# Altium project 底板开发板_Project.PrjPcb
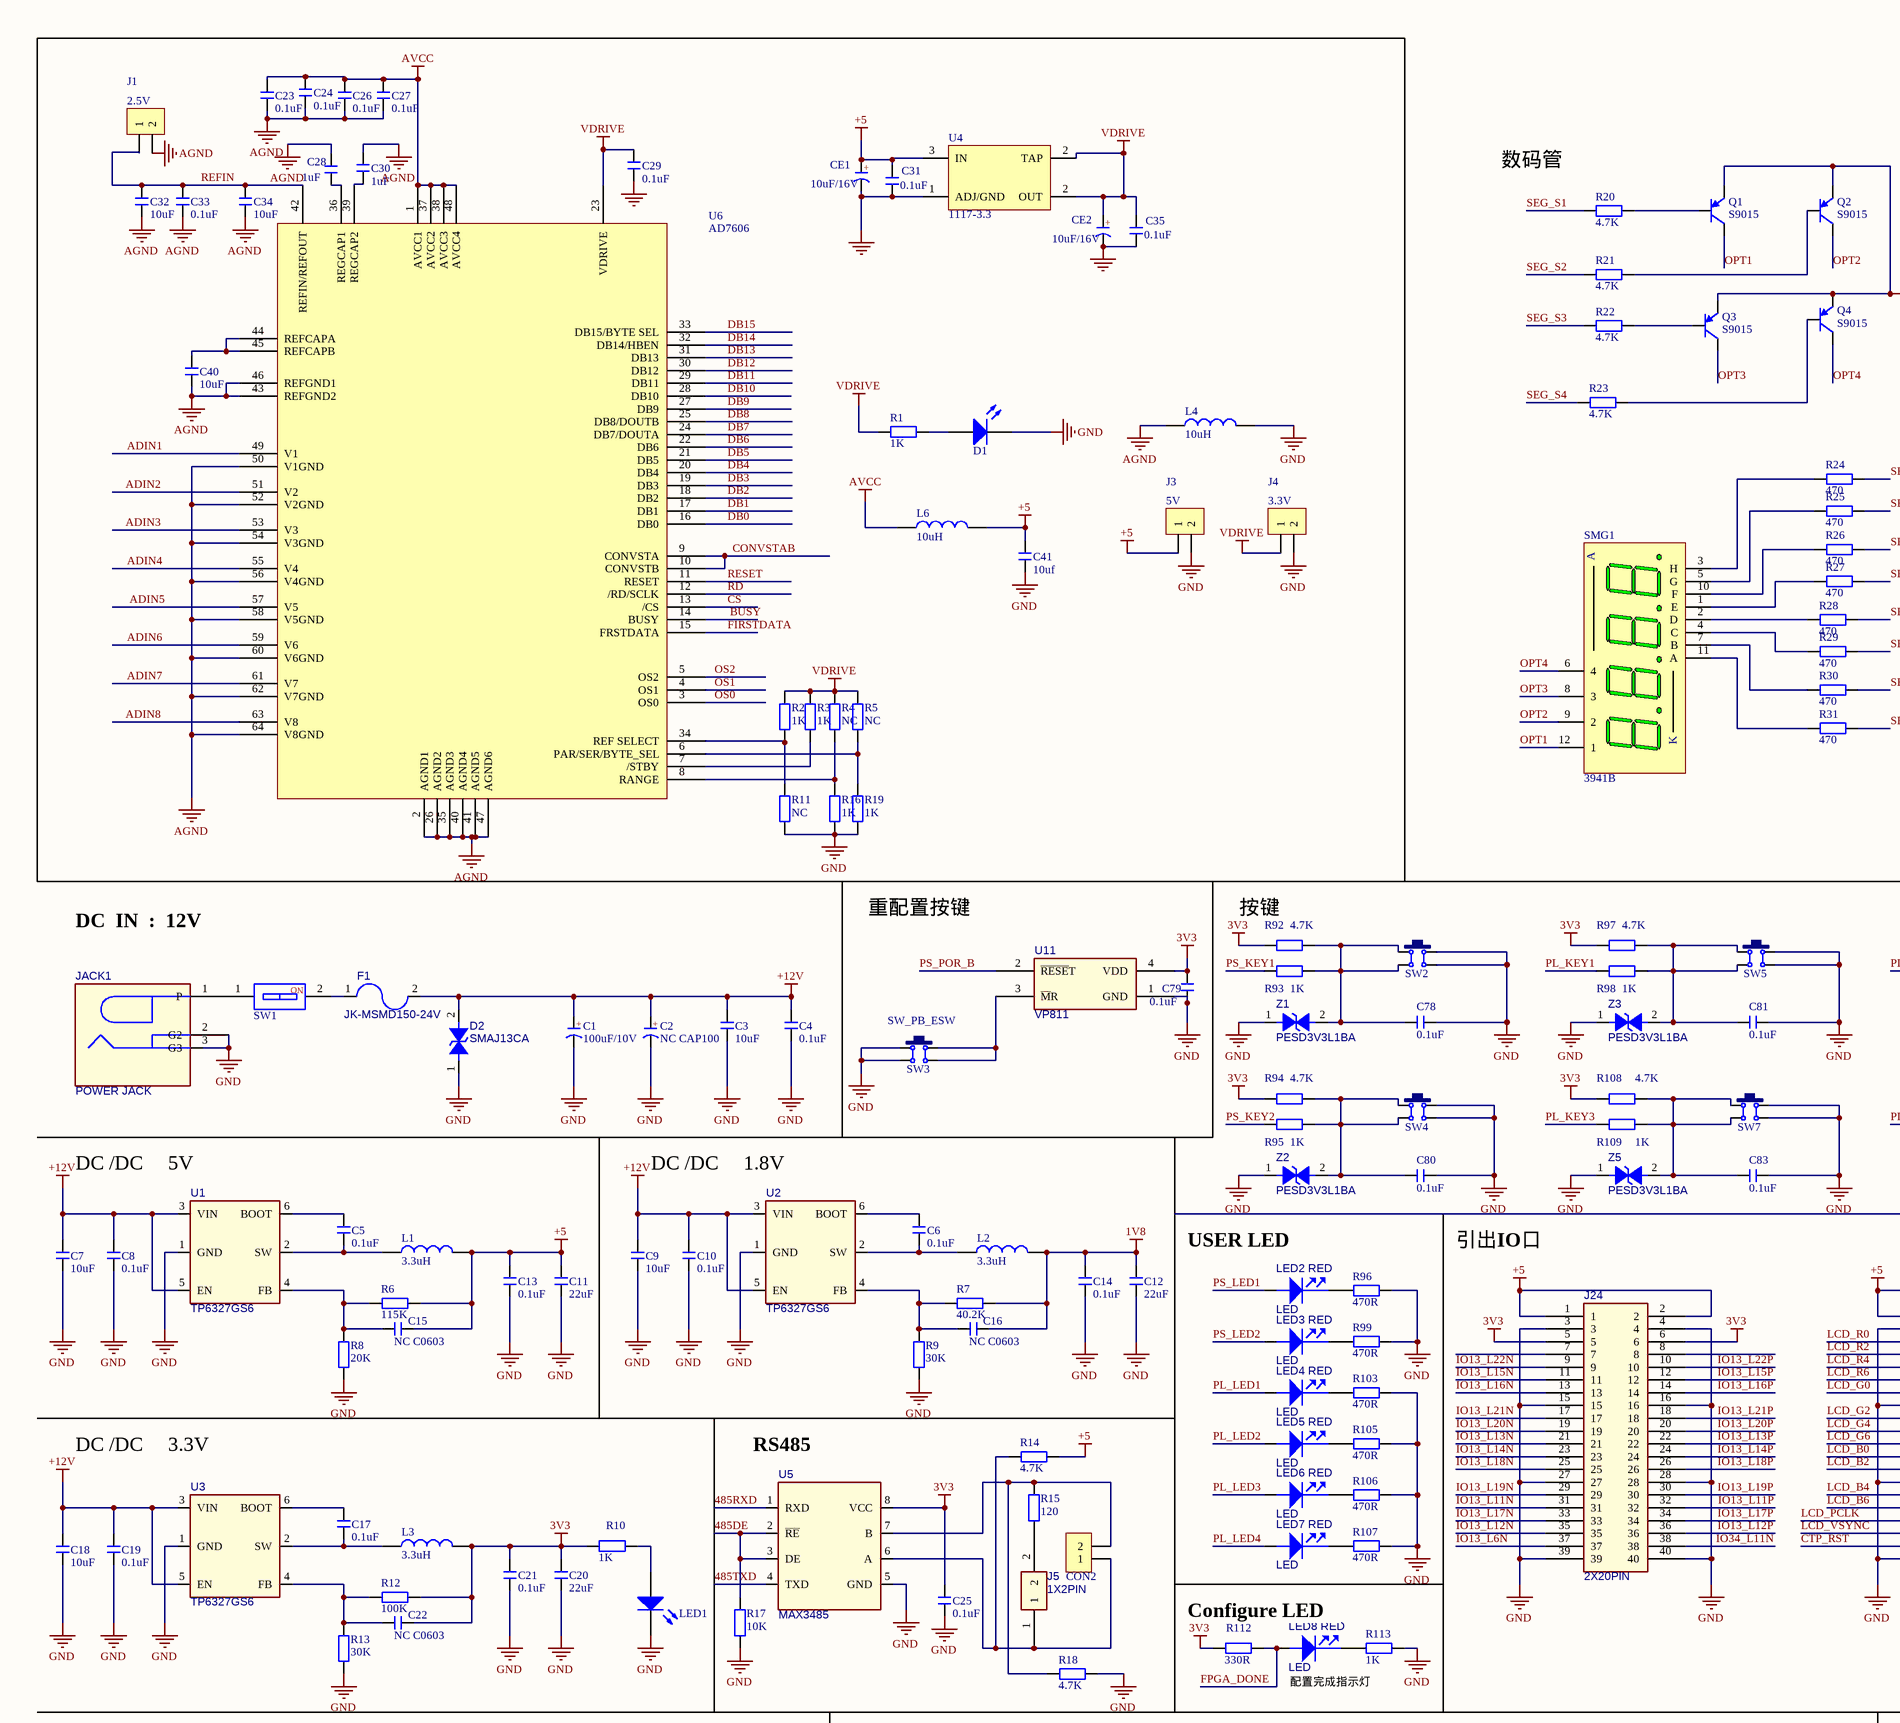
[diagram p0: 后改2025底板电路原理图.SchDoc, top left]
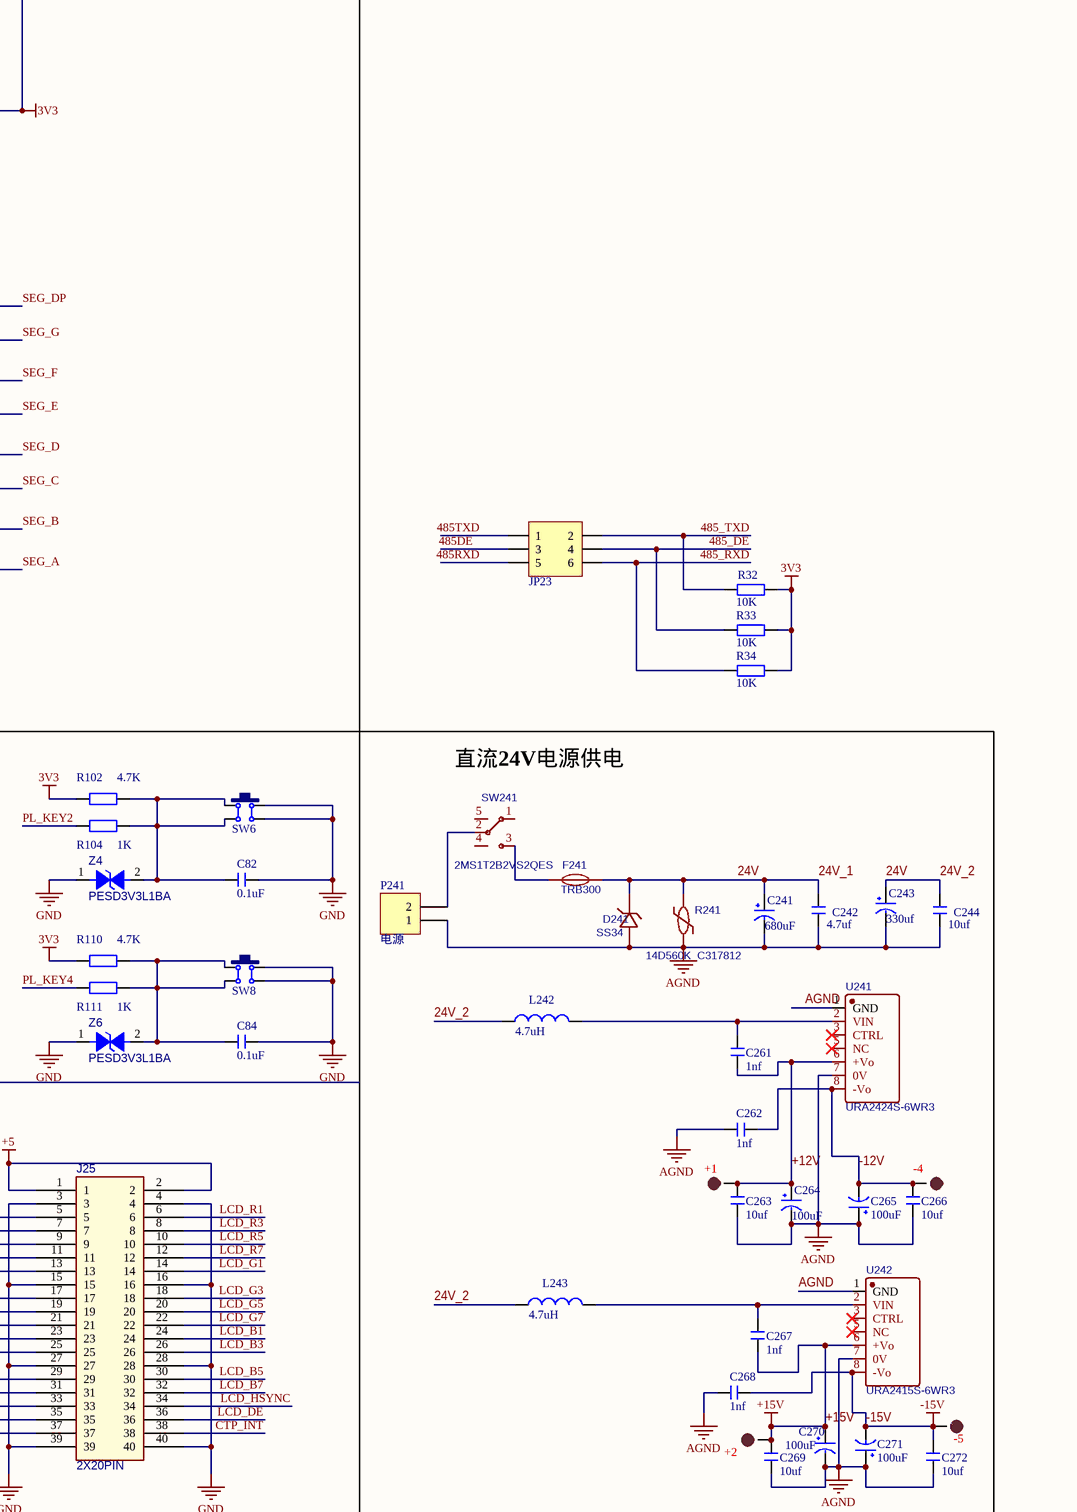
[diagram p1: 后改2025底板电路原理图.SchDoc, top right]
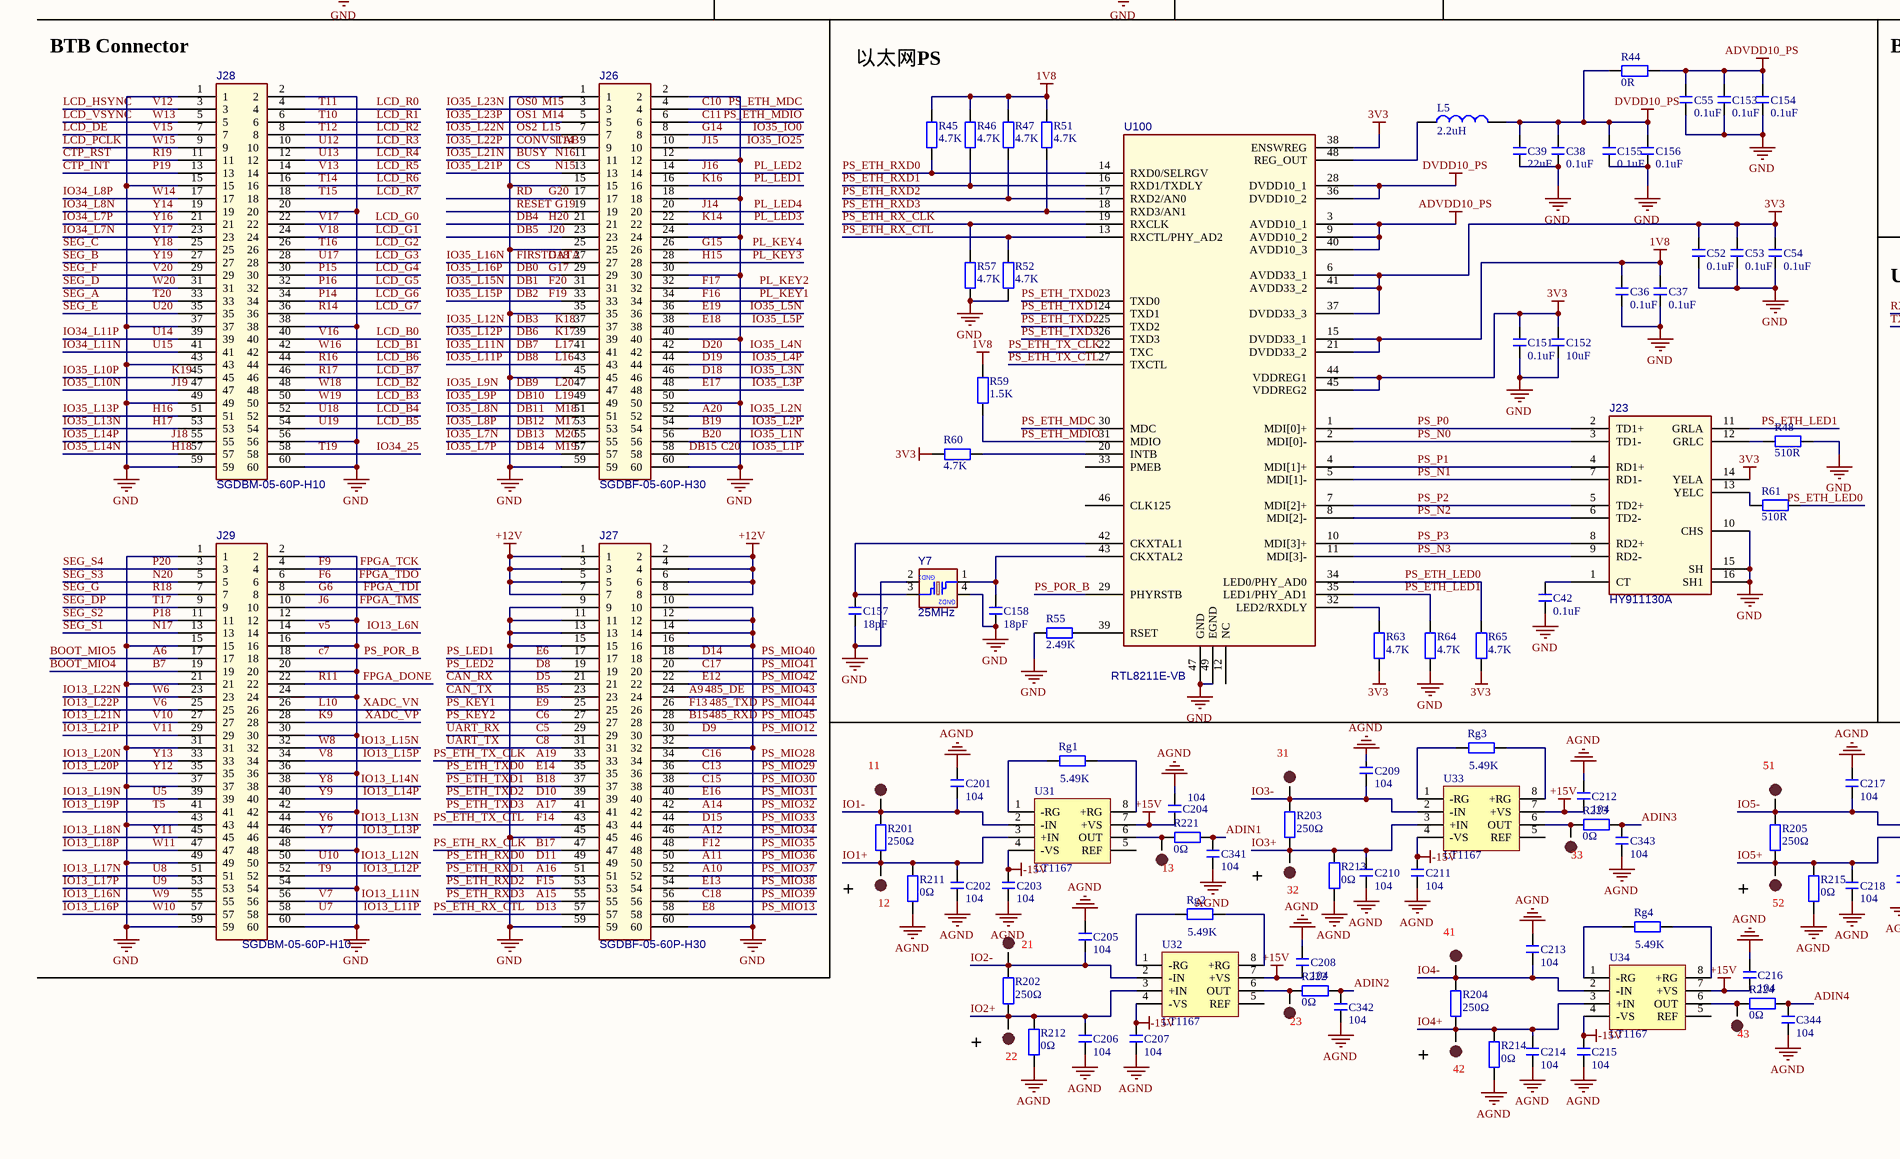
[diagram p2: 后改2025底板电路原理图.SchDoc, bottom left]
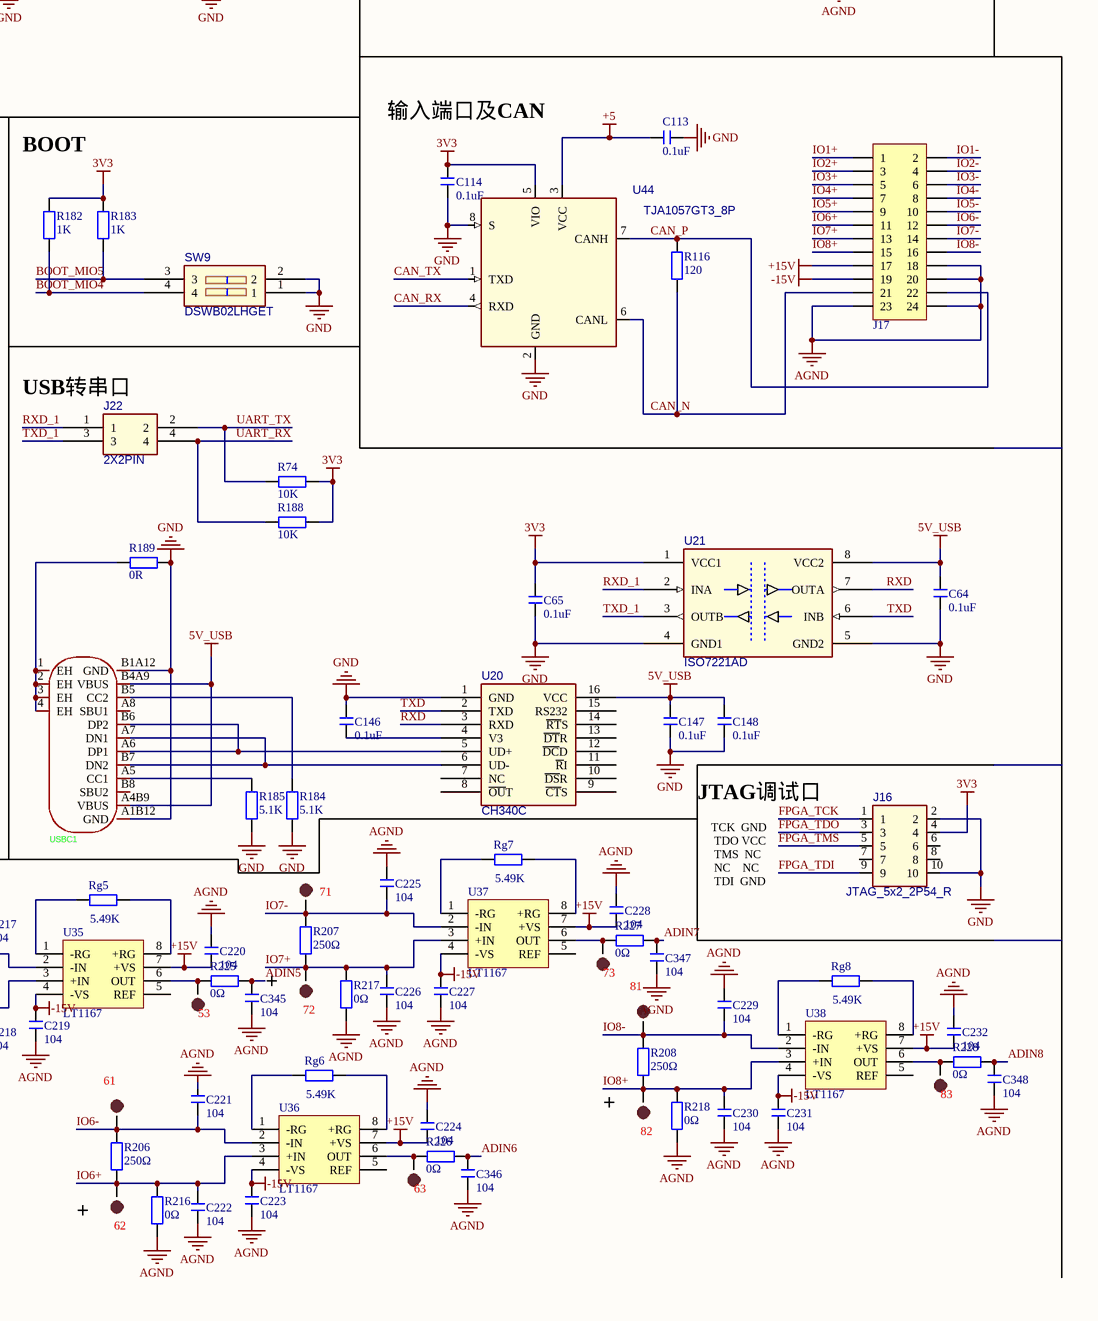
[diagram p3: 后改2025底板电路原理图.SchDoc, bottom right]
1 sheet, 347 parts. Net scope: global (net labels, ports and power ports of the same name join across sheets).
Board file: 后改2025底板线路板图.PcbDoc

## Sheet 后改2025底板电路原理图.SchDoc
size A1; SheetNumber: 1; SheetTotal: 1

### Parts
11  TEST POINT  [TEST]  (value not drawn)
12  TEST POINT  [TEST]  (value not drawn)
13  TEST POINT  [TEST]  (value not drawn)
21  TEST POINT  [TEST]  (value not drawn)
22  TEST POINT  [TEST]  (value not drawn)
23  TEST POINT  [TEST]  (value not drawn)
31  TEST POINT  [TEST]  (value not drawn)
32  TEST POINT  [TEST]  (value not drawn)
33  TEST POINT  [TEST]  (value not drawn)
41  TEST POINT  [TEST]  (value not drawn)
42  TEST POINT  [TEST]  (value not drawn)
43  TEST POINT  [TEST]  (value not drawn)
51  TEST POINT  [TEST]  (value not drawn)
52  TEST POINT  [TEST]  (value not drawn)
53  TEST POINT  [TEST]  (value not drawn)
61  TEST POINT  [TEST]  (value not drawn)
62  TEST POINT  [TEST]  (value not drawn)
63  TEST POINT  [TEST]  (value not drawn)
71  TEST POINT  [TEST]  (value not drawn)
72  TEST POINT  [TEST]  (value not drawn)
73  TEST POINT  [TEST]  (value not drawn)
81  TEST POINT  [TEST]  (value not drawn)
82  TEST POINT  [TEST]  (value not drawn)
83  TEST POINT  [TEST]  (value not drawn)
+1  TEST POINT  [TEST]  (value not drawn)
+2  TEST POINT  [TEST]  (value not drawn)
-4  TEST POINT  [TEST]  (value not drawn)
-5  TEST POINT  [TEST]  (value not drawn)
C1  100uF/10V  [CM D(6.3*5.4)]
C2  NC CAP100  [CM D(6.3*5.4)]
C3  10uF  [C 0805_L]
C4  0.1uF  [C 0805_L]
C5  0.1uF  [0603]
C6  0.1uF  [0603]
C7  10uF  [0603]
C8  0.1uF  [0603]
C9  10uF  [0603]
C10  0.1uF  [0603]
C11  22uF  [0603]
C12  22uF  [0603]
C13  0.1uF  [0603]
C14  0.1uF  [0603]
C15  NC C0603  [0603]
C16  NC C0603  [0603]
C17  0.1uF  [0603]
C18  10uF  [0603]
C19  0.1uF  [0603]
C20  22uF  [0603]
C21  0.1uF  [0603]
C22  NC C0603  [0603]
C23  0.1uF  [C 0805_L]
C24  0.1uF  [C 0805_L]
C25  0.1uF  [0603]
C26  0.1uF  [C 0805_L]
C27  0.1uF  [C 0805_L]
C28  1uF  [C 0805_L]
C29  0.1uF  [C 0805_L]
C30  1uF  [C 0805_L]
C31  0.1uF  [C 0805_L]
C32  10uF  [C 0805_L]
C33  0.1uF  [C 0805_L]
C34  10uF  [C 0805_L]
C35  0.1uF  [C 0805_L]
C36  0.1uF  [0603]
C37  0.1uF  [0603]
C38  0.1uF  [0603]
C39  22uF  [0603]
C40  10uF  [C 0805_L]
C41  10uf  [C 0805_L]
C42  0.1uF  [0603]
C52  0.1uF  [0603]
C53  0.1uF  [0603]
C54  0.1uF  [0603]
C55  0.1uF  [0603]
C64  0.1uF  [0603]
C65  0.1uF  [0603]
C78  0.1uF  [C 0805_L]
C79  0.1uF  [0603]
C80  0.1uF  [C 0805_L]
C81  0.1uF  [C 0805_L]
C82  0.1uF  [C 0805_L]
C83  0.1uF  [C 0805_L]
C84  0.1uF  [C 0805_L]
C113  0.1uF  [0603]
C114  0.1uF  [0603]
C146  0.1uF  [0603]
C147  0.1uF  [0603]
C148  0.1uF  [0603]
C151  0.1uF  [0603]
C152  10uF  [0603]
C153  0.1uF  [0603]
C154  0.1uF  [0603]
C155  0.1uF  [0603]
C156  0.1uF  [0603]
C157  18pF  [0603]
C158  18pF  [0603]
C201  104  [C 0603_L]
C202  104  [C 0603_L]
C203  104  [C 0603_L]
C204  104  [C 0603_L]
C205  104  [C 0603_L]
C206  104  [C 0603_L]
C207  104  [C 0603_L]
C208  104  [C 0603_L]
C209  104  [C 0603_L]
C210  104  [C 0603_L]
C211  104  [C 0603_L]
C212  104  [C 0603_L]
C213  104  [C 0603_L]
C214  104  [C 0603_L]
C215  104  [C 0603_L]
C216  104  [C 0603_L]
C217  104  [C 0603_L]
C218  104  [C 0603_L]
C219  104  [C 0603_L]
C220  104  [C 0603_L]
C221  104  [C 0603_L]
C222  104  [C 0603_L]
C223  104  [C 0603_L]
C224  104  [C 0603_L]
C225  104  [C 0603_L]
C226  104  [C 0603_L]
C227  104  [C 0603_L]
C228  104  [C 0603_L]
C229  104  [C 0603_L]
C230  104  [C 0603_L]
C231  104  [C 0603_L]
C232  104  [C 0603_L]
C241  680uF  [CAP-TH_BD13.0-P5.00-D1.2-FD]
C242  4.7uf  [0603C]
C243  330uf  [CAP-TH_BD10.0-P5.00-D1.0-FD]
C244  10uf  [0603C]
C261  1nf  [0603C]
C262  1nf  [0603C]
C263  10uf  [0603C]
C264  100uF  [CAP-TH_BD8.0-P3.50-D0.6-FD]
C265  100uF  [CAP-TH_BD8.0-P3.50-D0.6-FD]
C266  10uf  [0603C]
C267  1nf  [0603C]
C268  1nf  [0603C]
C269  10uf  [0603C]
C270  100uF  [CAP-TH_BD8.0-P3.50-D0.6-FD]
C271  100uF  [CAP-TH_BD8.0-P3.50-D0.6-FD]
C272  10uf  [0603C]
C341  104  [C 0603_L]
C342  104  [C 0603_L]
C343  104  [C 0603_L]
C344  104  [C 0603_L]
C345  104  [C 0603_L]
C346  104  [C 0603_L]
C347  104  [C 0603_L]
C348  104  [C 0603_L]
CE1  10uF/16V  [CM B(4*5.4)]
CE2  10uF/16V  [CM B(4*5.4)]
CON2  HDR-1X2  [KF128-5.08-2P]  (value not drawn)
D1  LED  [LED 0805R]  (value not drawn)
D2  SMAJ13CA  [SMA]
D241  SS34  [SMA_L4.4-W2.8-LS5.4-RD]
F1  JK-MSMD150-24V  [1812]
F241  TRB300  [FUSE-TH_L13.0-W3.1-P5.10-D0.8-S1.40]
J1  2.5V  [2pin]
J3  5V  [2pin]
J4  3.3V  [2pin]
J5  1X2PIN  [HDR2.54-Y-LI-2P]
J16  JTAG_5x2_2P54_R  [HDR2.54-LI-2x5P]
J17  Header 2X11  [IDC2.54-LI-2x12P]  (value not drawn)
J22  2X2PIN  [HDR2X2_B]
J23  HY911130A  [RJ45-TH_10P-P2.54-S2.54_L16.1-W21.4_HY911130A]
J24  2X20PIN  [HDR2.54-LI-2x20P]
J25  2X20PIN  [HDR2.54-LI-2x20P]
J26  SGDBF-05-60P-H30  [CONN-SMD_60P-P0.50_SGDBF-05-60P_1]
J27  SGDBF-05-60P-H30  [CONN-SMD_60P-P0.50_SGDBF-05-60P_1]
J28  SGDBM-05-60P-H10  [CONN-SMD_60P-P0.50_SGDBM-05-60P_1]
J29  SGDBM-05-60P-H10  [CONN-SMD_60P-P0.50_SGDBM-05-60P_1]
JACK1  POWER JACK  [DC-005]
JP23  Header3X2  [HDR2.54-LI-2x3P]  (value not drawn)
L1  3.3uH  [L 0805]
L2  3.3uH  [L 0805]
L3  3.3uH  [L 0805]
L4  10uH  [L 0603]
L5  2.2uH  [L 0805]
L6  10uH  [L 0805]
L242  4.7uH  [1210L]
L243  4.7uH  [1210L]
LED1  LED  [0603]  (value not drawn)
LED2_RED  LED  [LED 0805R]
LED3_RED  LED  [LED 0805R]
LED4_RED  LED  [LED 0805R]
LED5_RED  LED  [LED 0805R]
LED6_RED  LED  [LED 0805R]
LED7_RED  LED  [LED 0805R]
LED8_RED  LED  [LED 0805R]
P241  电源  [CONN-TH_2P-P5.08]
Q1  S9015  [SOT23-3N]
Q2  S9015  [SOT23-3N]
Q3  S9015  [SOT23-3N]
Q4  S9015  [SOT23-3N]
R1  1K  [R 0805_L]
R2  1K  [R 0805_L]
R3  1K  [R 0805_L]
R4  NC  [R 0805_L]
R5  NC  [R 0805_L]
R6  115K  [0603]
R7  40.2K  [0603]
R8  20K  [0603]
R9  30K  [0603]
R10  1K  [0603]
R11  NC  [R 0805_L]
R12  100K  [0603]
R13  30K  [0603]
R14  4.7K  [0603]
R15  120  [0603]
R16  1K  [R 0805_L]
R17  10K  [0603]
R18  4.7K  [0603]
R19  1K  [R 0805_L]
R20  4.7K  [R 0603_L]
R21  4.7K  [R 0603_L]
R22  4.7K  [R 0603_L]
R23  4.7K  [R 0603_L]
R24  470  [R 0603_L]
R25  470  [R 0603_L]
R26  470  [R 0603_L]
R27  470  [R 0603_L]
R28  470  [R 0603_L]
R29  470  [R 0603_L]
R30  470  [R 0603_L]
R31  470  [R 0603_L]
R32  10K  [0603]
R33  10K  [0603]
R34  10K  [0603]
R44  0R  [0603]
R45  4.7K  [0603]
R46  4.7K  [0603]
R47  4.7K  [0603]
R48  510R  [0603]
R51  4.7K  [0603]
R52  4.7K  [0603]
R55  2.49K  [0603]
R57  4.7K  [0603]
R59  1.5K  [0603]
R60  4.7K  [0603]
R61  510R  [0603]
R63  4.7K  [0603]
R64  4.7K  [0603]
R65  4.7K  [0603]
R74  10K  [0603]
R92  4.7K  [0603]
R93  1K  [0603]
R94  4.7K  [0603]
R95  1K  [0603]
R96  470R  [0603]
R97  4.7K  [0603]
R98  1K  [0603]
R99  470R  [0603]
R102  4.7K  [0603]
R103  470R  [0603]
R104  1K  [0603]
R105  470R  [0603]
R106  470R  [0603]
R107  470R  [0603]
R108  4.7K  [0603]
R109  1K  [0603]
R110  4.7K  [0603]
R111  1K  [0603]
R112  330R  [0603]
R113  1K  [0603]
R116  120  [0603]
R182  1K  [0603]
R183  1K  [0603]
R184  5.1K  [0603]
R185  5.1K  [0603]
R188  10K  [0603]
R189  0R  [0603]
R201  250Ω  [R 0603_L]
R202  250Ω  [R 0603_L]
R203  250Ω  [R 0603_L]
R204  250Ω  [R 0603_L]
R205  250Ω  [R 0603_L]
R206  250Ω  [R 0603_L]
R207  250Ω  [R 0603_L]
R208  250Ω  [R 0603_L]
R211  0Ω  [R 0603_L]
R212  0Ω  [R 0603_L]
R213  0Ω  [R 0603_L]
R214  0Ω  [R 0603_L]
R215  0Ω  [R 0603_L]
R216  0Ω  [R 0603_L]
R217  0Ω  [R 0603_L]
R218  0Ω  [R 0603_L]
R221  0Ω  [R 0603_L]
R222  0Ω  [R 0603_L]
R223  0Ω  [R 0603_L]
R224  0Ω  [R 0603_L]
R225  0Ω  [R 0603_L]
R226  0Ω  [R 0603_L]
R227  0Ω  [R 0603_L]
R228  0Ω  [R 0603_L]
R241  14D560K_C317812  [RES-TH_L16.5-W3.5-P7.50-D0.8-S2.10]
Rg1  5.49K  [R 0603_L]
Rg2  5.49K  [R 0603_L]
Rg3  5.49K  [R 0603_L]
Rg4  5.49K  [R 0603_L]
Rg5  5.49K  [R 0603_L]
Rg6  5.49K  [R 0603_L]
Rg7  5.49K  [R 0603_L]
Rg8  5.49K  [R 0603_L]
SMG1  3941B  [SMG 0.39-4P_A]
SW1  SW-1P  [CSW DIP-1P]  (value not drawn)
SW2  SW_PB_ESW  [TSW SMD-6*6*4.3]  (value not drawn)
SW3  SW_PB_ESW  [TSW SMD-6*6*4.3]
SW4  SW4  [TSW SMD-6*6*4.3]  (value not drawn)
SW5  SW_PB_ESW  [TSW SMD-6*6*4.3]  (value not drawn)
SW6  SW_PB_ESW  [TSW SMD-6*6*4.3]  (value not drawn)
SW7  SW_PB_ESW  [TSW SMD-6*6*4.3]  (value not drawn)
SW8  SW_PB_ESW  [TSW SMD-6*6*4.3]  (value not drawn)
SW9  DSWB02LHGET  [CSW DIP-2P]
SW241  2MS1T2B2VS2QES  [SW-TH_2MS1T2B2VS2QES]
U1  TP6327GS6  [SOT-23-6]
U2  TP6327GS6  [SOT-23-6]
U3  TP6327GS6  [SOT-23-6]
U4  1117-3.3  [SOT-223]
U5  MAX3485  [SOIC-8]
U6  AD7606  [LQFP-64]
U11  VP811  [SOT-143]
U20  CH340C  [SOP-16]
U21  ISO7221AD  [SOIC-8]
U31  LT1167  [SO-8]
U32  LT1167  [SO-8]
U33  LT1167  [SO-8]
U34  LT1167  [SO-8]
U35  LT1167  [SO-8]
U36  LT1167  [SO-8]
U37  LT1167  [SO-8]
U38  LT1167  [SO-8]
U44  TJA1057GT3_8P  [SOIC-8]
U100  RTL8211E-VB  [QFN-48_L6.0-W6.0-P0.40-BL-EP3.8]
U241  URA2424S-6WR3  [PWRM-TH_7P-L22.0-W9.5-P2.54_TESLA_URA2424S-6WR3]
U242  URA2415S-6WR3  [PWRM-TH_7P-L22.0-W9.5-P2.54_TESLA_URA2424S-6WR3]
USBC1  TYPE-C-31-M-12  [USB-C_SMD-TYPE-C-31-M-12_1]  (value not drawn)
Y7  25MHz  [SMD3225-4P]
Z1  PESD3V3L1BA  [SOD-323]
Z2  PESD3V3L1BA  [SOD-323]
Z3  PESD3V3L1BA  [SOD-323]
Z4  PESD3V3L1BA  [SOD-323]
Z5  PESD3V3L1BA  [SOD-323]
Z6  PESD3V3L1BA  [SOD-323]

### Nets
1V8: C12.2 C14.2 C16.1 C36.2 C37.2 L2.2 R7.1 R45.2 R46.2 R47.2 R51.2 R59.2 U100.15(DVDD33_1) U100.21(DVDD33_2)
3V3: C20.2 C21.2 C22.1 C25.2 C52.2 C53.2 C54.2 C65.1 C79.2 C114.2 C151.2 C152.2 J16.4 J23.14(YELA) J24.5 J24.6 L3.2 Q1.2(E) Q2.2(E) Q3.2(E) Q4.2(E) R10.2 R12.1 R32.2 R33.2 R34.2 R60.2 R63.2 R65.2 R74.2 R92.2 R94.2 R97.2 R102.2 R108.2 R110.2 R112.2 R182.1 R183.1 R188.2 U5.8(VCC) U11.4(VDD) U21.1(VCC1) U44.5(VIO) U100.6(AVDD33_1) U100.37(DVDD33_3) U100.38(ENSWREG) U100.41(AVDD33_2) U100.44(VDDREG1) U100.45(VDDREG2)
5V_USB: C64.2 C147.1 C148.1 U20.16(VCC) U21.8(VCC2) USBC1.A4B9(VBUS) USBC1.B4A9(VBUS)
+5: C11.2 C13.2 C15.1 C31.2 C41.2 C113.2 CE1.1(A) J3.1 J24.1 J24.2 J25.1 J25.2 L1.2 L6.2 R6.1 R14.2 U4.3(IN) U44.3(VCC)
+12V: +1.1 C1.1(A) C2.1(A) C3.2 C4.2 C7.2 C8.2 C9.2 C10.2 C18.2 C19.2 C261.2 C263.1 C264.1(VCC) D2.2 F1.2 J27.1 J27.2 J27.3 J27.4 J27.5 J27.6 J27.7 J27.8 U1.3(VIN) U1.5(EN) U2.3(VIN) U2.5(EN) U3.3(VIN) U3.5(EN) U241.6(+Vo)
+15V: +2.1 C204.1 C208.1 C212.1 C216.1 C220.1 C224.1 C228.1 C232.1 C267.2 C269.1 C270.1(VCC) J17.17 U31.7(+VS) U32.7(+VS) U33.7(+VS) U34.7(+VS) U35.7(+VS) U36.7(+VS) U37.7(+VS) U38.7(+VS) U242.6(+Vo)
-15V: -5.1 C203.2 C207.2 C211.2 C215.2 C219.2 C223.2 C227.2 C231.2 C268.2 C271.2(GND) C272.1 J17.19 U31.4(-VS) U32.4(-VS) U33.4(-VS) U34.4(-VS) U35.4(-VS) U36.4(-VS) U37.4(-VS) U38.4(-VS) U242.8(-Vo)
ADVDD10_PS: C55.2 C153.2 C154.2 R44.1 U100.3(AVDD10_1) U100.9(AVDD10_2) U100.40(AVDD10_3)
AGND: C23.1 C24.1 C26.1 C27.1 C28.2 C30.2 C32.1 C33.1 C34.1 C40.1 C201.2 C202.1 C203.1 C204.2 C205.2 C206.1 C207.1 C208.2 C209.2 C210.1 C211.1 C212.2 C213.2 C214.1 C215.1 C216.2 C217.2 C218.1 C219.1 C220.2 C221.2 C222.1 C223.1 C224.2 C225.2 C226.1 C227.1 C228.2 C229.2 C230.1 C231.1 C232.2 C241.2(GND) C242.2 C243.2(GND) C244.2 C262.1 C263.2 C264.2(GND) C265.1(VCC) C266.2 C268.1 C269.2 C270.2(GND) C271.1(VCC) C272.2 C341.1 C342.1 C343.1 C344.1 C345.1 C346.1 C347.1 C348.1 D241.2(A) J1.2 J17.18 J17.20 J17.23 J17.24 L4.1 P241.1 R211.2 R212.2 R213.2 R214.2 R215.2 R216.2 R217.2 R218.2 R241.2 U6.2(AGND1) U6.26(AGND2) U6.35(AGND3) U6.40(AGND4) U6.41(AGND5) U6.43(REFGND2) U6.46(REFGND1) U6.47(AGND6) U6.50(V1GND) U6.52(V2GND) U6.54(V3GND) U6.56(V4GND) U6.58(V5GND) U6.60(V6GND) U6.62(V7GND) U6.64(V8GND) U241.1(GND) U241.7(0V) U242.1(GND) U242.7(0V)
AVCC: C23.2 C24.2 C26.2 C27.2 L6.1 U6.1(AVCC1) U6.37(AVCC2) U6.38(AVCC3) U6.48(AVCC4)
DVDD10_PS: C38.2 C39.2 C155.2 C156.2 L5.2 R44.2 U100.28(DVDD10_1) U100.36(DVDD10_2)
GND: C1.2(K) C2.2(K) C3.1 C4.1 C7.1 C8.1 C9.1 C10.1 C11.1 C12.1 C13.1 C14.1 C18.1 C19.1 C20.1 C21.1 C25.1 C29.1 C31.1 C35.1 C36.1 C37.1 C38.1 C39.1 C41.1 C42.1 C52.1 C53.1 C54.1 C55.1 C64.1 C65.2 C78.1 C79.1 C80.1 C81.1 C82.1 C83.1 C84.1 C113.1 C114.1 C146.1 C147.2 C148.2 C151.1 C152.1 C153.1 C154.1 C155.1 C156.1 C157.1 C158.1 CE1.2(K) CE2.2(K) D1.2(K) D2.1 J3.2 J4.2 J16.2 J16.10 J23.10(CHS) J23.15(SH) J23.16(SH1) J24.3 J24.4 J24.15 J24.16 J24.27 J24.28 J24.39 J24.40 J25.3 J25.4 J25.15 J25.16 J25.27 J25.28 J25.39 J25.40 J26.1 J26.2 J26.12 J26.15 J26.18 J26.24 J26.25 J26.30 J26.35 J26.40 J26.45 J26.50 J26.59 J26.60 J27.9 J27.10 J27.11 J27.12 J27.13 J27.14 J27.15 J27.16 J27.32 J27.45 J27.59 J27.60 J28.1 J28.2 J28.15 J28.20 J28.37 J28.38 J28.43 J28.49 J28.56 J28.59 J28.60 J29.1 J29.2 J29.12 J29.15 J29.16 J29.20 J29.21 J29.24 J29.30 J29.31 J29.36 J29.37 J29.42 J29.43 J29.48 J29.49 J29.54 J29.59 J29.60 JACK1.2(G2) JACK1.3(G3) L4.2 LED1.2(K) R8.1 R9.1 R11.1 R13.1 R16.1 R17.1 R18.2 R19.1 R48.1 R52.1 R55.2 R57.1 R64.2 R96.1 R99.1 R103.1 R105.1 R106.1 R107.1 R113.1 R184.2 R185.2 R189.1 SW2.2 SW2.3 SW3.1 SW3.4 SW4.2 SW4.3 SW5.2 SW5.3 SW6.2 SW6.3 SW7.2 SW7.3 SW8.2 SW8.3 SW9.1 SW9.2 U1.1(GND) U2.1(GND) U3.1(GND) U4.1(ADJ/GND) U5.5(GND) U11.1(GND) U20.1(GND) U21.4(GND1) U21.5(GND2) U44.2(GND) U44.8(S) U100.47(GND) U100.49(EGND) USBC1.A1B12(GND) USBC1.B1A12(GND) Y7.2(GND1) Y7.4(GND2) Z1.1 Z2.1 Z3.1 Z4.1 Z5.1 Z6.1
VDRIVE: C29.2 C35.2 CE2.1(A) J4.1 R1.1 R2.2 R3.2 R4.2 R5.2 U4.2(OUT) U6.23(VDRIVE)
24V: C241.1(VCC) C242.1 C243.1(VCC) C244.1 D241.1(C) F241.2 L242.1 L243.1 R241.1  [also labelled 24V_1, 24V_2]
485_DE: J27.24 JP23.4 R33.1  [also labelled A9, PS_MIO43]
485_RXD: J27.28 JP23.6 R34.1  [also labelled B15, PS_MIO45]
485_TXD: J27.26 JP23.2 R32.1  [also labelled F13, PS_MIO44]
485DE: JP23.3 R17.2 U5.2(~{RE}) U5.3(DE)
485RXD: JP23.5 U5.1(RXD)
485TXD: JP23.1 U5.4(TXD)
-12V: -4.1 C262.2 C265.2(GND) C266.1 U241.8(-Vo)
A6: J29.17 R183.2 SW9.3  [also labelled BOOT_MIO5]
A10: J27.52  [also labelled PS_MIO37]
A11: J27.50  [also labelled PS_MIO36]
A12: J27.46  [also labelled PS_MIO34]
A14: J27.42  [also labelled PS_MIO32]
A15: J27.55 R51.1 U100.18(RXD3/AN1)  [also labelled PS_ETH_RXD3]
A16: J27.51 R46.1 U100.16(RXD1/TXDLY)  [also labelled PS_ETH_RXD1]
A17: J27.41 U100.26(TXD3)  [also labelled PS_ETH_TXD3]
A19: J27.33 U100.22(TXC)  [also labelled PS_ETH_TX_CLK]
A20: J26.52  [also labelled IO35_L2N]
ADIN1: C341.2 R221.2 U6.49(V1)
ADIN2: C342.2 R222.2 U6.51(V2)
ADIN3: C343.2 R223.2 U6.53(V3)
ADIN4: C344.2 R224.2 U6.55(V4)
ADIN5: C345.2 R225.2 U6.57(V5)
ADIN6: C346.2 R226.2 U6.59(V6)
ADIN7: C347.2 R227.2 U6.61(V7)
ADIN8: C348.2 R228.2 U6.63(V8)
B5: J27.23 U44.1(TXD)  [also labelled CAN_TX]
B7: J29.19 R182.2 SW9.4  [also labelled BOOT_MIO4]
B17: J27.47 R57.2 U100.19(RXCLK)  [also labelled PS_ETH_RX_CLK]
B18: J27.37 U100.24(TXD1)  [also labelled PS_ETH_TXD1]
B19: J26.54  [also labelled IO35_L2P]
B20: J26.56  [also labelled IO35_L1N]
BUSY: J26.11 U6.14(BUSY)  [also labelled IO35_L21N, N16]
C5: J22.4 J27.29 R188.1  [also labelled UART_RX]
C6: J27.27 R95.2  [also labelled PS_KEY2]
c7: J29.18 U11.2(~{RESE}T) U100.29(PHYRSTB)  [also labelled PS_POR_B]
C8: J22.2 J27.31 R74.1  [also labelled UART_TX]
C10: J26.4 U100.30(MDC)  [also labelled PS_ETH_MDC]
C11: J26.6 R59.1 U100.31(MDIO)  [also labelled PS_ETH_MDIO]
C13: J27.36  [also labelled PS_MIO29]
C15: J27.38  [also labelled PS_MIO30]
C16: J27.34  [also labelled PS_MIO28]
C17: J27.20  [also labelled PS_MIO41]
C18: J27.56  [also labelled PS_MIO39]
C20: J26.58 U6.33(DB15/BYTE_SEL)  [also labelled DB15, IO35_L1P]
CAN_N: J17.21 R116.2 U44.6(CANL)
CAN_P: J17.22 R116.1 U44.7(CANH)
CAN_RX: J27.21 U44.4(RXD)  [also labelled D5]
CONVSTAB: J26.9 U6.9(CONVSTA) U6.10(CONVSTB)  [also labelled IO35_L22P, L14]
CS: J26.13 U6.13(/CS)  [also labelled IO35_L21P, N15]
CTP_INT: J25.38 J28.13  [also labelled P19]
CTP_RST: J25.37 J28.11  [also labelled R19]
D8: J27.19 LED3_RED.2(ANODE)  [also labelled PS_LED2]
D9: J27.30  [also labelled PS_MIO12]
D10: J27.39 U100.25(TXD2)  [also labelled PS_ETH_TXD2]
D11: J27.49 R45.1 U100.14(RXD0/SELRGV)  [also labelled PS_ETH_RXD0]
D13: J27.57 R52.2 U100.13(RXCTL/PHY_AD2)  [also labelled PS_ETH_RX_CTL]
D14: J27.18  [also labelled PS_MIO40]
D15: J27.44  [also labelled PS_MIO33]
D18: J26.46  [also labelled IO35_L3N]
D19: J26.44  [also labelled IO35_L4P]
D20: J26.42  [also labelled IO35_L4N]
DB0: J26.29 U6.16(DB0)  [also labelled G17, IO35_L16P]
DB1: J26.31 U6.17(DB1)  [also labelled F20, IO35_L15N]
DB2: J26.33 U6.18(DB2)  [also labelled F19, IO35_L15P]
DB3: J26.37 U6.19(DB3)  [also labelled IO35_L12N, K18]
DB4: J26.21 U6.20(DB4)  [also labelled H20]
DB5: J26.23 U6.21(DB5)  [also labelled J20]
DB6: J26.39 U6.22(DB6)  [also labelled IO35_L12P, K17]
DB7: J26.41 U6.24(DB7/DOUTA)  [also labelled IO35_L11N, L17]
DB8: J26.43 U6.25(DB8/DOUTB)  [also labelled IO35_L11P, L16]
DB9: J26.47 U6.27(DB9)  [also labelled IO35_L9N, L20]
DB10: J26.49 U6.28(DB10)  [also labelled IO35_L9P, L19]
DB11: J26.51 U6.29(DB11)  [also labelled IO35_L8N, M18]
DB12: J26.53 U6.30(DB12)  [also labelled IO35_L8P, M17]
DB13: J26.55 U6.31(DB13)  [also labelled IO35_L7N, M20]
DB14: J26.57 U6.32(DB14/HBEN)  [also labelled IO35_L7P, M19]
E6: J27.17 LED2_RED.2(ANODE)  [also labelled PS_LED1]
E8: J27.58  [also labelled PS_MIO13]
E9: J27.25 R93.2  [also labelled PS_KEY1]
E12: J27.22  [also labelled PS_MIO42]
E13: J27.54  [also labelled PS_MIO38]
E14: J27.35 U100.23(TXD0)  [also labelled PS_ETH_TXD0]
E16: J27.40  [also labelled PS_MIO31]
E17: J26.48  [also labelled IO35_L3P]
E18: J26.38  [also labelled IO35_L5P]
E19: J26.36  [also labelled IO35_L5N]
F6: J16.3 J29.6  [also labelled FPGA_TDO]
F9: J16.1 J29.4  [also labelled FPGA_TCK]
F12: J27.48  [also labelled PS_MIO35]
F14: J27.43 U100.27(TXCTL)  [also labelled PS_ETH_TX_CTL]
F15: J27.53 R47.1 U100.17(RXD2/AN0)  [also labelled PS_ETH_RXD2]
F16: J26.34 R98.2  [also labelled PL_KEY1]
F17: J26.32 R104.2  [also labelled PL_KEY2]
FIRSTDATA: J26.27 U6.15(FRSTDATA)  [also labelled G18, IO35_L16N]
FPGA_DONE: J29.22 LED8_RED.2(ANODE) R112.1  [also labelled R11]
FPGA_TDI: J16.9 J29.8  [also labelled G6]
FPGA_TMS: J16.5 J29.10  [also labelled J6]
G14: J26.8  [also labelled IO35_IO0]
G15: J26.26 R111.2  [also labelled PL_KEY4]
G19: J26.19 U6.11(RESET)  [also labelled RESET]
G20: J26.17 U6.12(/RD/SCLK)  [also labelled RD]
H15: J26.28 R109.2  [also labelled PL_KEY3]
H16: J28.51  [also labelled IO35_L13P]
H17: J28.53  [also labelled IO35_L13N]
H18: J28.57  [also labelled IO35_L14N]
IO1+: 12.1 C202.2 J17.1 R201.2 R211.1 U31.3(+IN)
IO1-: 11.1 C201.1 J17.2 R201.1 U31.2(-IN)
IO2+: 22.1 C206.2 J17.3 R202.2 R212.1 U32.3(+IN)
IO2-: 21.1 C205.1 J17.4 R202.1 U32.2(-IN)
IO3+: 32.1 C210.2 J17.5 R203.2 R213.1 U33.3(+IN)
IO3-: 31.1 C209.1 J17.6 R203.1 U33.2(-IN)
IO4+: 42.1 C214.2 J17.7 R204.2 R214.1 U34.3(+IN)
IO4-: 41.1 C213.1 J17.8 R204.1 U34.2(-IN)
IO5+: 52.1 C218.2 J17.9 R205.2 R215.1 U35.3(+IN)
IO5-: 51.1 C217.1 J17.10 R205.1 U35.2(-IN)
IO6+: 62.1 C222.2 J17.11 R206.2 R216.1 U36.3(+IN)
IO6-: 61.1 C221.1 J17.12 R206.1 U36.2(-IN)
IO7+: 72.1 C226.2 J17.13 R207.2 R217.1 U37.3(+IN)
IO7-: 71.1 C225.1 J17.14 R207.1 U37.2(-IN)
IO8+: 82.1 C230.2 J17.15 R208.2 R218.1 U38.3(+IN)
IO8-: 81.1 C229.1 J17.16 R208.1 U38.2(-IN)
IO13_L6N: J24.37 J29.14  [also labelled v5]
IO13_L11N: J24.31 J29.56  [also labelled V7]
IO13_L11P: J24.32 J29.58  [also labelled U7]
IO13_L12N: J24.35 J29.50  [also labelled U10]
IO13_L12P: J24.36 J29.52  [also labelled T9]
IO13_L13N: J24.21 J29.44  [also labelled Y6]
IO13_L13P: J24.22 J29.46  [also labelled Y7]
IO13_L14N: J24.23 J29.38  [also labelled Y8]
IO13_L14P: J24.24 J29.40  [also labelled Y9]
IO13_L15N: J24.11 J29.32  [also labelled W8]
IO13_L15P: J24.12 J29.34  [also labelled V8]
IO13_L16N: J24.13 J29.55  [also labelled W9]
IO13_L16P: J24.14 J29.57  [also labelled W10]
IO13_L17N: J24.33 J29.51  [also labelled U8]
IO13_L17P: J24.34 J29.53  [also labelled U9]
IO13_L18N: J24.25 J29.45  [also labelled Y11]
IO13_L18P: J24.26 J29.47  [also labelled W11]
IO13_L19N: J24.29 J29.39  [also labelled U5]
IO13_L19P: J24.30 J29.41  [also labelled T5]
IO13_L20N: J24.19 J29.33  [also labelled Y13]
IO13_L20P: J24.20 J29.35  [also labelled Y12]
IO13_L21N: J24.17 J29.27  [also labelled V10]
IO13_L21P: J24.18 J29.29  [also labelled V11]
IO13_L22N: J24.9 J29.23  [also labelled W6]
IO13_L22P: J24.10 J29.25  [also labelled V6]
IO34_25: J28.58  [also labelled T19]
IO34_L7N: J28.23  [also labelled Y17]
IO34_L7P: J28.21  [also labelled Y16]
IO34_L8N: J28.19  [also labelled Y14]
IO34_L8P: J28.17  [also labelled W14]
IO34_L11N: J24.38 J28.41  [also labelled U15]
IO34_L11P: J28.39  [also labelled U14]
IO35_IO25: J26.10  [also labelled J15]
IO35_L10N: J28.47  [also labelled J19]
IO35_L10P: J28.45  [also labelled K19]
IO35_L14P: J28.55  [also labelled J18]
IO35_L22N: J26.7 U6.5(OS2)  [also labelled L15, OS2]
IO35_L23N: J26.3 U6.3(OS0)  [also labelled M15, OS0]
IO35_L23P: J26.5 U6.4(OS1)  [also labelled M14, OS1]
J14: J26.20 LED7_RED.2(ANODE)  [also labelled PL_LED4]
J16: J26.14 LED5_RED.2(ANODE)  [also labelled PL_LED2]
K9: J29.28  [also labelled XADC_VP]
K14: J26.22 LED6_RED.2(ANODE)  [also labelled PL_LED3]
K16: J26.16 LED4_RED.2(ANODE)  [also labelled PL_LED1]
L10: J29.26  [also labelled XADC_VN]
LCD_B0: J25.23 J28.40  [also labelled V16]
LCD_B1: J25.24 J28.42  [also labelled W16]
LCD_B2: J25.25 J28.48  [also labelled W18]
LCD_B3: J25.26 J28.50  [also labelled W19]
LCD_B4: J25.29 J28.52  [also labelled U18]
LCD_B5: J25.30 J28.54  [also labelled U19]
LCD_B6: J25.31 J28.44  [also labelled R16]
LCD_B7: J25.32 J28.46  [also labelled R17]
LCD_DE: J25.36 J28.7  [also labelled V15]
LCD_G0: J25.13 J28.22  [also labelled V17]
LCD_G1: J25.14 J28.24  [also labelled V18]
LCD_G2: J25.17 J28.26  [also labelled T16]
LCD_G3: J25.18 J28.28  [also labelled U17]
LCD_G4: J25.19 J28.30  [also labelled P15]
LCD_G5: J25.20 J28.32  [also labelled P16]
LCD_G6: J25.21 J28.34  [also labelled P14]
LCD_G7: J25.22 J28.36  [also labelled R14]
LCD_HSYNC: J25.34 J28.3  [also labelled V12]
LCD_PCLK: J25.33 J28.9  [also labelled W15]
LCD_R0: J25.5 J28.4  [also labelled T11]
LCD_R1: J25.6 J28.6  [also labelled T10]
LCD_R2: J25.7 J28.8  [also labelled T12]
LCD_R3: J25.8 J28.10  [also labelled U12]
LCD_R4: J25.9 J28.12  [also labelled U13]
LCD_R5: J25.10 J28.14  [also labelled V13]
LCD_R6: J25.11 J28.16  [also labelled T14]
LCD_R7: J25.12 J28.18  [also labelled T15]
LCD_VSYNC: J25.35 J28.5  [also labelled W13]
N17: J29.13 R20.1  [also labelled SEG_S1]
N20: J29.5 R22.1  [also labelled SEG_S3]
OPT1: Q1.3(C) SMG1.12(1)
OPT2: Q2.3(C) SMG1.9(2)
OPT3: Q3.3(C) SMG1.8(3)
OPT4: Q4.3(C) SMG1.6(4)
P18: J29.11 R21.1  [also labelled SEG_S2]
P20: J29.3 R23.1  [also labelled SEG_S4]
PS_ETH_LED0: R61.1 R65.1 U100.34(LED0/PHY_AD0)
PS_ETH_LED1: J23.11(GRLA) R64.1 U100.35(LED1/PHY_AD1)
PS_N0: J23.3(TD1-) U100.2(MDI[0]-)
PS_N1: J23.7(RD1-) U100.5(MDI[1]-)
PS_N2: J23.6(TD2-) U100.8(MDI[2]-)
PS_N3: J23.9(RD2-) U100.11(MDI[3]-)
PS_P0: J23.2(TD1+) U100.1(MDI[0]+)
PS_P1: J23.4(RD1+) U100.4(MDI[1]+)
PS_P2: J23.5(TD2+) U100.7(MDI[2]+)
PS_P3: J23.8(RD2+) U100.10(MDI[3]+)
R18: J29.7 R25.2  [also labelled SEG_G]
REFIN: C32.2 C33.2 C34.2 J1.1 U6.42(REFIN/REFOUT)
RXD: U20.3(RXD) U21.7(OUTA)
RXD_1: J22.1 U21.2(INA)
SEG_A: J28.33 R31.2  [also labelled T20]
SEG_B: J28.27 R30.2  [also labelled Y19]
SEG_C: J28.25 R29.2  [also labelled Y18]
SEG_D: J28.31 R28.2  [also labelled W20]
SEG_DP: J29.9 R24.2  [also labelled T17]
SEG_E: J28.35 R27.2  [also labelled U20]
SEG_F: J28.29 R26.2  [also labelled V20]
TXD: U20.2(TXD) U21.6(INB)
TXD_1: J22.3 U21.3(OUTB)
Net13_1: 13.1 R221.1 U31.6(OUT)
Net23_1: 23.1 R222.1 U32.6(OUT)
Net33_1: 33.1 R223.1 U33.6(OUT)
Net43_1: 43.1 R224.1 U34.6(OUT)
Net53_1: 53.1 R225.1 U35.6(OUT)
Net63_1: 63.1 R226.1 U36.6(OUT)
Net73_1: 73.1 R227.1 U37.6(OUT)
Net83_1: 83.1 R228.1 U38.6(OUT)
NetC5_1: C5.1 L1.1 U1.2(SW)
NetC5_2: C5.2 U1.6(BOOT)
NetC6_1: C6.1 L2.1 U2.2(SW)
NetC6_2: C6.2 U2.6(BOOT)
NetC15_2: C15.2 R6.2 R8.2 U1.4(FB)
NetC16_2: C16.2 R7.2 R9.2 U2.4(FB)
NetC17_1: C17.1 L3.1 U3.2(SW)
NetC17_2: C17.2 U3.6(BOOT)
NetC22_2: C22.2 R12.2 R13.2 U3.4(FB)
NetC28_1: C28.1 U6.36(REGCAP1)
NetC30_1: C30.1 U6.39(REGCAP2)
NetC40_2: C40.2 U6.44(REFCAPA) U6.45(REFCAPB)
NetC42_2: C42.2 J23.1(CT)
NetC78_2: C78.2 R92.1 R93.1 SW2.1 SW2.4 Z1.2
NetC80_2: C80.2 R94.1 R95.1 SW4.1 SW4.4 Z2.2
NetC81_2: C81.2 R97.1 R98.1 SW5.1 SW5.4 Z3.2
NetC82_2: C82.2 R102.1 R104.1 SW6.1 SW6.4 Z4.2
NetC83_2: C83.2 R108.1 R109.1 SW7.1 SW7.4 Z5.2
NetC84_2: C84.2 R110.1 R111.1 SW8.1 SW8.4 Z6.2
NetC146_2: C146.2 U20.4(V3)
NetC157_2: C157.2 U100.42(CKXTAL1) Y7.3
NetC158_2: C158.2 U100.43(CKXTAL2) Y7.1
NetC261_1: C261.1 L242.2 U241.2(VIN)
NetC267_1: C267.1 L243.2 U242.2(VIN)
NetCON2_1: CON2.1 J5.1 R14.1 U5.6(A)
NetCON2_2: CON2.2 R15.2 R18.1 U5.7(B)
NetD1_1: D1.1(A) R1.2
NetF1_1: F1.1 SW1.2
NetF241_1: F241.1 SW241.3
NetJ5_2: J5.2 R15.1
NetJ23_12: J23.12(GRLC) R48.2
NetJ23_13: J23.13(YELC) R61.2
NetJACK1_1: JACK1.1(P) SW1.1
NetL5_1: L5.1 U100.48(REG_OUT)
NetLED1_1: LED1.1(A) R10.1
NetLED2_RED_1: LED2_RED.1(CATHODE) R96.2
NetLED3_RED_1: LED3_RED.1(CATHODE) R99.2
NetLED4_RED_1: LED4_RED.1(CATHODE) R103.2
NetLED5_RED_1: LED5_RED.1(CATHODE) R105.2
NetLED6_RED_1: LED6_RED.1(CATHODE) R106.2
NetLED7_RED_1: LED7_RED.1(CATHODE) R107.2
NetLED8_RED_1: LED8_RED.1(CATHODE) R113.2
NetP241_2: P241.2 SW241.2
NetQ1_1: Q1.1(B) R20.2
NetQ2_1: Q2.1(B) R21.2
NetQ3_1: Q3.1(B) R22.2
NetQ4_1: Q4.1(B) R23.2
NetR2_1: R2.1 R11.2 U6.34(REF_SELECT)
NetR3_1: R3.1 U6.7(/STBY)
NetR4_1: R4.1 R16.2 U6.8(RANGE)
NetR5_1: R5.1 R19.2 U6.6(PAR/SER/BYTE_SEL)
NetR24_1: R24.1 SMG1.3(H)
NetR25_1: R25.1 SMG1.5(G)
NetR26_1: R26.1 SMG1.10(F)
NetR27_1: R27.1 SMG1.1(E)
NetR28_1: R28.1 SMG1.2(D)
NetR29_1: R29.1 SMG1.4(C)
NetR30_1: R30.1 SMG1.7(B)
NetR31_1: R31.1 SMG1.11(A)
NetR55_1: R55.1 U100.39(RSET)
NetR60_1: R60.1 U100.20(INTB)
NetR63_1: R63.1 U100.32(LED2/RXDLY)
NetR184_1: R184.1 USBC1.B5(CC2)
NetR185_1: R185.1 USBC1.A5(CC1)
NetR189_2: R189.2 USBC1.1(EH) USBC1.2(EH) USBC1.3(EH) USBC1.4(EH)
NetRg1_1: Rg1.1 U31.1(-RG)
NetRg1_2: Rg1.2 U31.8(+RG)
NetRg2_1: Rg2.1 U32.1(-RG)
NetRg2_2: Rg2.2 U32.8(+RG)
NetRg3_1: Rg3.1 U33.1(-RG)
NetRg3_2: Rg3.2 U33.8(+RG)
NetRg4_1: Rg4.1 U34.1(-RG)
NetRg4_2: Rg4.2 U34.8(+RG)
NetRg5_1: Rg5.1 U35.1(-RG)
NetRg5_2: Rg5.2 U35.8(+RG)
NetRg6_1: Rg6.1 U36.1(-RG)
NetRg6_2: Rg6.2 U36.8(+RG)
NetRg7_1: Rg7.1 U37.1(-RG)
NetRg7_2: Rg7.2 U37.8(+RG)
NetRg8_1: Rg8.1 U38.1(-RG)
NetRg8_2: Rg8.2 U38.8(+RG)
NetSW3_2: SW3.2 SW3.3 U11.3(~{M}R)
NetU20_5: U20.5(UD+) USBC1.A6(DP1) USBC1.B6(DP2)
NetU20_6: U20.6(UD-) USBC1.A7(DN1) USBC1.B7(DN2)

Not connected (* = marked no-connect by the designer): J16 6 7 8; J24 7 8; SW241 1 4 5; U20 7(NC) 8(~{OU}T) 9(~{CT}S) 10(~{DS}R) 11(~{R}I) 12(~{DC}D) 13(~{DT}R) 14(~{RT}S) 15(RS232); U31 5(REF); U32 5(REF); U33 5(REF); U34 5(REF); U35 5(REF); U36 5(REF); U37 5(REF); U38 5(REF); U100 12(NC) 33(PMEB) 46(CLK125); U241 3(CTRL)* 5(NC)*; U242 3(CTRL)* 5(NC)*; USBC1 A8(SBU1) B8(SBU2)

### Notes on the sheet
- (near R20) 数码管
- DC  IN  :  12V
- 重配置按键
- (near R92) 按键
- (near SW241) 直流24V电源供电
- (near U1) DC /DC     5V
- (near U2) DC /DC     1.8V
- USER LED
- 引出IO口
- DC /DC     3.3V
- RS485
- Configure LED
- 配置完成指示灯
- 输入端口及CAN
- (near J28) BTB Connector
- 以太网PS
- BOOT
- (near J22) USB转串口
- JTAG调试口
- 一
- TCK  GND
  TDO VCC
  TMS  NC
  NC    NC
  TDI  GND
- (near C345) +
- +
- (in symbol 3941B) K
- (in symbol CE_SMD) +
- (in symbol SW-1P) NO

### Library data of the parts
11-13 21-23 31-33 41-43 51-53 61-63 71-73 81-83 +1 +2 -4 -5 = TEST-POINT: 测试点
C1 C2 CE1 CE2 = CE_SMD: 贴片电解电容; 版权归属: 封装库来自淘宝 ID：黄晶宝石; BOM名称: 贴片电解电容; 联系售后: https://shop463601444.taobao.com
C3-C42 C52-C55 C64 C65 C78-C84 C113 C114 C146-C148 C151-C158 C201-C232 C341-C348 = C: 贴片电容; BOM名称: 无极性贴片电容; 淘宝ID: 封装库来自淘宝 ID：黄晶宝石; 联系售后，技术支持: https://shop463601444.taobao.com; 唯一出售店铺网址: https://shop463601444.taobao.com
C241 C243 C264 C265 C270 C271 = CAP
C242 C244 C261-C263 C266-C269 C272 = C: 无极性贴片电容; 版权归属: 源创客; BOM名称: 无极性贴片电容; 学习资源: www.ooocke.com
CON2 = Header 2: 2P接插件; 版权归属: 封装库来自淘宝卖家 ID：黄晶宝石; BOM名称: 2P接插件; 学习资源: https://shop463601444.taobao.com
D1 LED1 = LED: 发光二极管; 技术支持，联系售后: https://shop463601444.taobao.com
D2 Z1-Z6 = DIODE BI-DIR TRIG
D241 = BZT52C24_C571382: BOM_Manufacturer: High Diode; Contributor: LCSC; BOM_Supplier: LCSC; BOM_Supplier Part: C571382; BOM_Manufacturer Part: BZT52C24; BOM_JLCPCB Part Class: Extended Part; spicePre: D; spiceSymbolName: BZT52C24_C571382
F1 = FUSE
F241 = TRB300: BOM_Manufacturer: TLC Electronic; Contributor: LCSC; BOM_Supplier: LCSC; BOM_Supplier Part: C262070; BOM_Manufacturer Part: TRB300; BOM_JLCPCB Part Class: Extended Part; spicePre: F; spiceSymbolName: TRB300
J1 J3 J4 = Header 2: 2P接插件; 版权归属: 封装库来自淘宝 ID：黄晶宝石; 技术支持，联系售后: 封装库来自淘宝卖家 ID：黄晶宝石; BOM名称: 2P接插件; 联系售后: https://shop463601444.taobao.com
J16 = 2X5PIN
J17 = Header 12X2: 12*2P接插件; 版权归属: 封装库来自淘宝卖家 ID：黄晶宝石; BOM名称: 12*2P接插件; 学习资源: https://shop463601444.taobao.com
J26-J29 = 2X30PIN
JP23 = Header 3X2: 3*2P接插件; 版权归属: 封装库来自淘宝 ID：黄晶宝石; BOM名称: 3*2P接插件; 学习资源: https://shop463601444.taobao.com
L1-L6 = L: 小功率贴片电感; 淘宝ID: 封装库来自淘宝 ID：黄晶宝石; 封装库来自淘宝卖家 ID：黄晶宝石: 其他店铺购入均为盗版，不享受售后技术支持服务，请立即申请退款; BOM名称: 小功率贴片电感; 联系售后: https://shop463601444.taobao.com
L242 L243 = Inductor: Code_IEC: 1005; Value: 15uH   0.6A; Published: 8-Jun-2000; LatestRevisionDate: 29-May-2009; LatestRevisionNote: IPC-7351 Footprint Added.; PackageReference: 0402-A; Publisher: Altium Limited; PackageDescription: Chip Inductor; Code_JEITA: 0402
P241 = Header 2: Header, 2-Pin; LatestRevisionDate: 17-Jul-2002; LatestRevisionNote: Re-released for DXP Platform.; Publisher: Altium Limited
Q1-Q4 = 9015-SMD: 低噪放大-PNP型; 版权归属: 封装库来自淘宝 ID：黄晶宝石; 属性: 50V 0.1A 0.4W 150MHZ; BOM名称: 低噪放大-PNP型; 技术支持，联系售后: https://shop463601444.taobao.com
R1-R34 R44-R48 R51 R52 R55 R57 R59-R61 R63-R65 R74 R92-R99 R102-R113 R116 R182-R185 R188 R189 R201-R208 R211-R218 R221-R228 Rg1-Rg8 = R: 贴片电阻; 版权归属: 来自淘宝 ID：黄晶宝石; 封装库来自淘宝卖家 ID：黄晶宝石: 其他店铺购入均为盗版，不享受售后技术支持服务，请立即申请退款; BOM名称: 贴片电阻; 联系售后: https://shop463601444.taobao.com
R241 = 14D560K_C317812: BOM_Manufacturer: COV; Contributor: LCSC; BOM_Supplier: LCSC; BOM_Supplier Part: C317812; BOM_Manufacturer Part: 14D560K; BOM_JLCPCB Part Class: Extended Part; spicePre: R; spiceSymbolName: 14D560K_C317812
SMG1 = 3941B: 0.36寸4位共阳数码管; 版权归属: 封装库来自淘宝卖家 ID：黄晶宝石; BOM名称: 0.36寸4位共阳; 学习资源: https://shop463601444.taobao.com
SW1 = SW-1P: 1路编码开关; 学习资源: 封装库来自淘宝 ID：黄晶宝石; BOM名称: 1路编码开关; 技术支持，联系售后: https://shop463601444.taobao.com
SW2 = TSW SMD-6x6: SW2; BOM名称: 贴片6x6轻触开关; 版权归属: 封装库来自淘宝 ID：黄晶宝石; 唯一出售店铺网址: https://shop463601444.taobao.com
SW3 SW6-SW8 = TSW SMD-6x6: BOM名称: 贴片6x6轻触开关; 版权归属: 封装库来自淘宝 ID：黄晶宝石; 唯一出售店铺网址: https://shop463601444.taobao.com
SW4 = TSW SMD-6x6: SW_PB_ESW; BOM名称: 贴片6x6轻触开关; 版权归属: 封装库来自淘宝 ID：黄晶宝石; 唯一出售店铺网址: https://shop463601444.taobao.com
SW5 = TSW SMD-6x6: SW5; BOM名称: 贴片6x6轻触开关; 版权归属: 封装库来自淘宝 ID：黄晶宝石; 唯一出售店铺网址: https://shop463601444.taobao.com
SW241 = 2MS1T2B2VS2QES: BOM_Manufacturer: Dailywell; Contributor: LCSC; BOM_Supplier: LCSC; BOM_Supplier Part: C545202; BOM_Manufacturer Part: 2MS1T2B2VS2QES; BOM_JLCPCB Part Class: Extended Part; spicePre: S; spiceSymbolName: 2MS1T2B2VS2QES
U5 = TJA1057GT3: CLASS: IC
U31-U38 = AD620BR: CI-AD620BR
U44 = TJA1057GT3_8P: CLASS: IC
U241 U242 = URA2424S-6WR3: BOM_Manufacturer: 清远特斯拉(TESL*A); Contributor: LCSC; BOM_Supplier: LCSC; BOM_Supplier Part: C917733; BOM_Manufacturer Part: URA2424S-6WR3; spicePre: U; spiceSymbolName: URA2424S-6WR3
USBC1 = TYPE-C-31-M-12: Manufacturer: 韩国韩荣; Add into BOM: yes; Connector Type: Type-C; Gender: 母; Number of Contacts: 16P; Number of Ports: 1; Current Rating-Power: 5A; Symbol: TYPE-C-31-M-12; Device: TYPE-C-31-M-12; LCSC Part Name: Type-C 母; Supplier Part: C165948; Manufacturer Part: TYPE-C-31-M-12; Supplier Footprint: SMD; JLCPCB Part Class: Extended Part; Datasheet: https://item.szlcsc.com/datasheet/TYPE-C-31-M-12/177331.html; Supplier: LCSC; Convert to PCB: yes; Protocol Standard: -; Mounting Type: -; Operating Temperature: -
Y7 = CRYSTAL_4P: CLASS: IC